# Altium schematic sheet 2_SCH_Autolog.SchDoc: PROYECTO FINAL - AutoLog
size A4; SheetNumber: 3; SheetTotal: 4
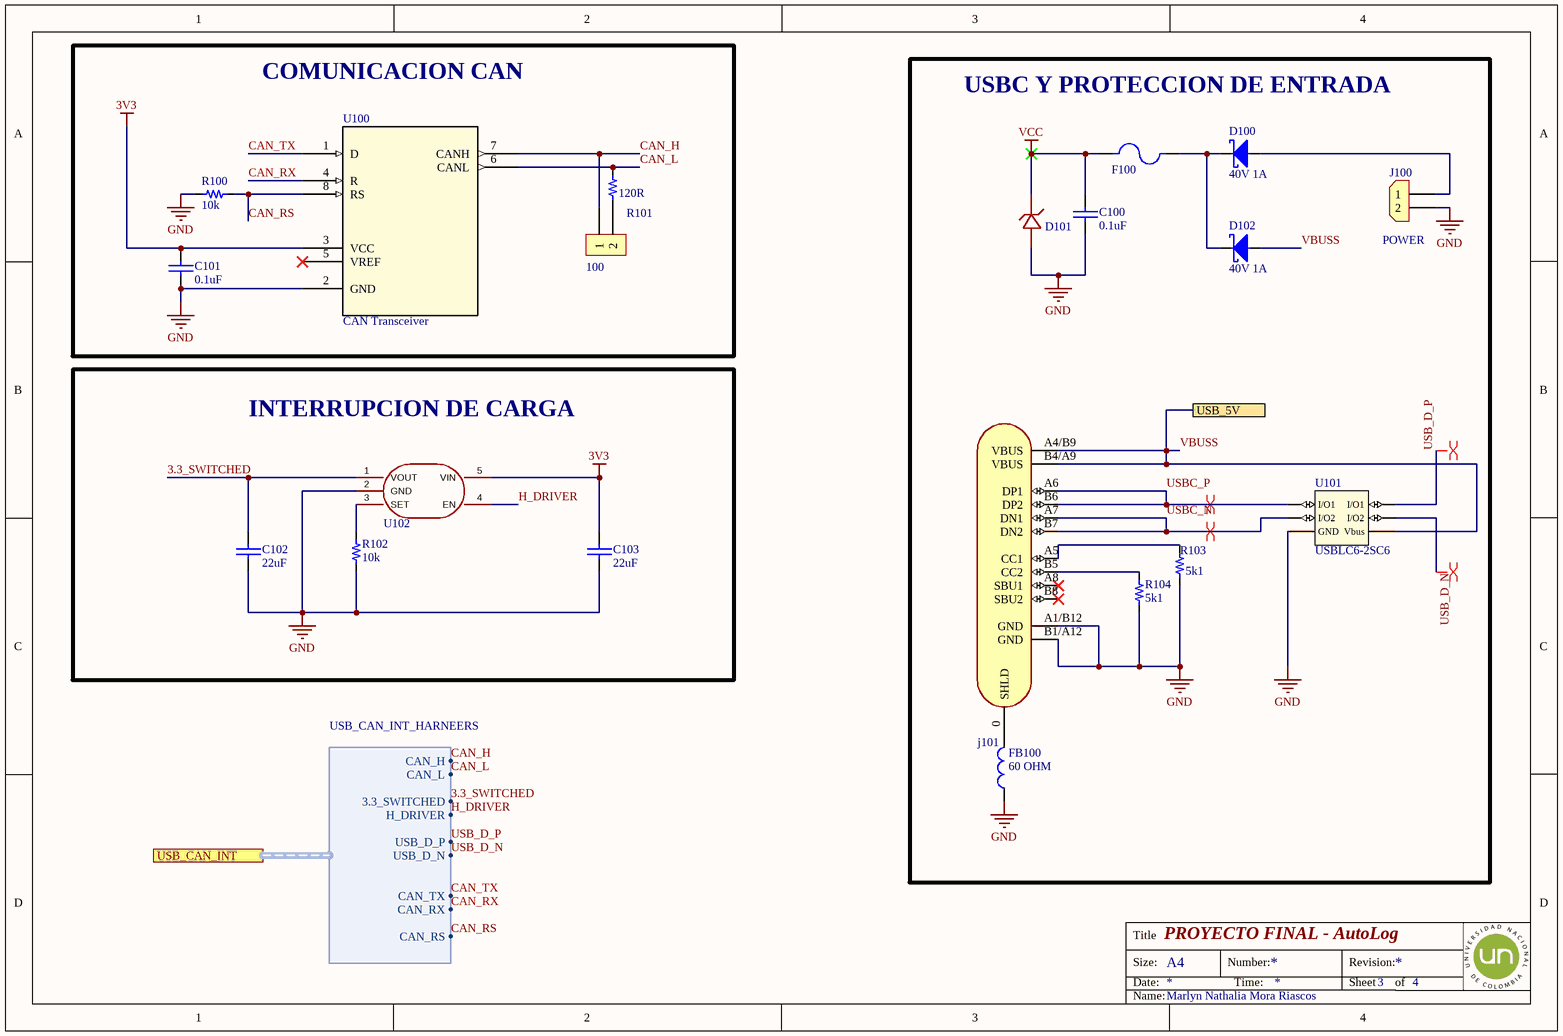
[diagram p0: 2_SCH_Autolog.SchDoc]

## Parts
100  2x1  [H_2x1_TH_100mil]  (value not drawn)  (no BOM)
C100  value 0.1uF  [0603_cap]  (hidden comment: 0.1uF 50V)
C101  value 0.1uF  [0603_cap]  (hidden comment: 0.1uF 50V)
C102  value 22uF  [0603_cap]  (hidden comment: 22uF 10V)
C103  value 22uF  [0603_cap]  (hidden comment: 22uF 10V)
D100  40V 1A  [SOD_123]
D101  TVS_DIODE_SMF30A  [TVS_DIODE_SMF30A]  (value not drawn)
D102  40V 1A  [SOD_123]
F100  PTC_MF-MSMF110/16-2  [FUSER_MF-MSMF110/16-2]  (value not drawn)
FB100  value 60 OHM  [0603_fb]  (hidden comment: 60OHM 2A)
J100  POWER  [CON_2x1_TH_5MM]
j101  USB C  [CON_USB_C_16P_RA]  (value not drawn)
R100  value 10k  [0603_res]  (hidden comment: 10k 1/10W)
R101  value 120R  [0603_res]  (hidden comment: 120R 1/10W)
R102  value 10k  [0603_res]  (hidden comment: 10k 1/10W)
R103  value 5k1  [0603_res]  (hidden comment: 5k1 1/10W)
R104  value 5k1  [0603_res]  (hidden comment: 5k1 1/10W)
U100  CAN Transceiver  [D8-M]
U101  USBLC6-2SC6  [SOT_23_6]
U102  MT9700  [SOT-23-5_L3.0-W1.7-P0.95-LS2.8-BR]  (value not drawn)

## Blocks framed on the sheet
COMUNICACION CAN: 100 C101 R100 R101 U100
USBC Y PROTECCION DE ENTRADA: C100 D100-D102 F100 FB100 J100 j101 R103 R104 U101
INTERRUPCION DE CARGA: C102 C103 R102 U102

## Ports
USB_5V (see Maiin[3B], 3_SCH_Autolog[3A]), USB_CAN_INT (harness USB_CAN_INT_HARNEERS, see Maiin[3A], 1_SCH_Autolog[2D])

## Harnesses
USB_CAN_INT_HARNEERS: USB_D_P, USB_D_N, H_DRIVER, 3.3_SWITCHED, CAN_L, CAN_TX, CAN_RX, CAN_RS, CAN_H

## Nets
3V3: C101.2 C103.1 U100.3(VCC) U102.5(VIN)
GND: C100.1 C101.1 C102.2 C103.2 D101.2 FB100.1 J100.2 j101.A1/B12(GND) j101.B1/A12(GND) R100.1 R102.1 R103.1 R104.2 U100.2(GND) U101.2(GND) U102.2(GND)
VCC: C100.2 D101.1 F100.1
3.3_SWITCHED: C102.1 U102.1(VOUT) ; port USB_CAN_INT.3.3_SWITCHED
CAN_H: 100.1 U100.7(CANH) ; port USB_CAN_INT.CAN_H
CAN_L: R101.2 U100.6(CANL) ; port USB_CAN_INT.CAN_L
CAN_RS: R100.2 U100.8(RS) ; port USB_CAN_INT.CAN_RS
CAN_RX: U100.4(R) ; port USB_CAN_INT.CAN_RX
CAN_TX: U100.1(D) ; port USB_CAN_INT.CAN_TX
H_DRIVER: U102.4(EN) ; port USB_CAN_INT.H_DRIVER
USB_D_N: U101.4(I/O2) ; port USB_CAN_INT.USB_D_N
USB_D_P: U101.6(I/O1) ; port USB_CAN_INT.USB_D_P
USBC_N: j101.A7(DN1) j101.B7(DN2) U101.3(I/O2)
USBC_P: j101.A6(DP1) j101.B6(DP2) U101.1(I/O1)
VBUSS: D102.2 j101.A4/B9(VBUS) j101.B4/A9(VBUS) U101.5(Vbus) ; port USB_5V
Net100_2: 100.2 R101.1
NetD100_1: D100.1 D102.1 F100.2
NetD100_2: D100.2 J100.1
NetFB100_2: FB100.2 j101.0(SHLD)
Netj101_A5: j101.A5(CC1) R103.2
Netj101_B5: j101.B5(CC2) R104.1
NetR102_2: R102.2 U102.3(SET)

Not connected (* = marked no-connect by the designer): j101 A8(SBU1)* B8(SBU2)*; U100 5(VREF)*

## Layout directives
differential pair: USB_D_N, USB_D_P, USBC_N, USBC_P

## Notes on the sheet
- Title
- Size:
- Date:
- A4
- Number:
- Time:
- Revision:
- Sheet
- of
- Name:
- Marlyn Nathalia Mora Riascos

## Library data of the parts
100 = H_Male_2x1_TH_100mil: ComponentLink1Description: LCSC
C100 C101 = Cap_0.1uF_0603_50V: 50V 100nF Y5V -20%~+80% 0603 Multilayer Ceramic Capacitors MLCC - SMD/SMT ROHS; Manufacturer: Walsin Tech Corp; Manufacturer Part Number: 0603F104Z500CT; Supplier 1: LCSC; Supplier Part Number 1: C83060; ComponentLink1Description: LCSC; ComponentLink1URL: https://www.lcsc.com/product-detail/Multilayer-Ceramic-Capacitors-MLCC-SMD-SMT_Walsin-Tech-Corp-0603F104Z500CT_C83060.html; ComponentLink2Description: Datasheet; ComponentLink2URL: https://www.lcsc.com/datasheet/C83060.pdf
C102 C103 = Cap_22uF_0603_10V: 10V 22uF X5R ±20% 0603 Multilayer Ceramic Capacitors MLCC - SMD/SMT ROHS; Manufacturer: HRE; Manufacturer Part Number: CGA0603X5R226M100JT; Supplier 1: LCSC; Supplier Part Number 1: C6119863; ComponentLink1Description: LCSC; ComponentLink1URL: https://lcsc.com/product-detail/Multilayer-Ceramic-Capacitors-MLCC-SMD-SMT_HRE-CGA0603X5R226M100JT_C6119863.html; ComponentLink2Description: Datasheet; ComponentLink2URL: https://www.lcsc.com/datasheet/C6119863.pdf
D100 D102 = D_Schottky_40V_1A_SOD_123F: DIODE SCHOTTKY 40V 1A SOD123F; Manufacturer: Shanghai Prisemi Elec; Manufacturer Part Number: PSBD1DF40V1H; Supplier 1: LCSC; Supplier Part Number 1: C110730; ComponentLink1Description: LCSC; ComponentLink1URL: https://www.lcsc.com/product-detail/Switching-Diode_Shanghai-Prisemi-Elec-PSBD1DF40V1H_C110730.html; ComponentLink2Description: Datasheet; ComponentLink2URL: https://www.lcsc.com/datasheet/C110730.pdf
D101 = TVS_DIODE_SMF30A: TVS DIODE 30VWM 48.4VC SOD123F; Manufacturer: Diotec Semiconductor; Manufacturer Part Number: SMF30A; Supplier 1: digikey; Supplier Part Number 1: 4878-SMF30ATR-ND; ComponentLink1Description: digikey; ComponentLink1URL: https://www.digikey.com/en/products/detail/diotec-semiconductor/SMF30A/13164473; ComponentLink2Description: Datasheet; ComponentLink2URL: https://diotec.com/request/datasheet/smf50a.pdf
F100 = PTC_MF-MSMF110/16-2: Polymeric PTC Resettable Fuse 16V 1.1 A Ih Surface Mount 1812 (4532 Metric), Concave; Manufacturer: Bourns Inc.; Manufacturer Part Number: MF-MSMF110/16-2; Supplier 1: digikey; Supplier Part Number 1: MF-MSMF110/16-2TR-ND; ComponentLink1Description: digikey; ComponentLink1URL: https://www.digikey.com/en/products/detail/bourns-inc/MF-MSMF110-16-2/662820?s=N4IgTCBcDaIEIHkCqAlAcgZQAQFkBiAtDhvgIykAMA9KQGwEQC6AvkA; ComponentLink2Description: Datasheet; ComponentLink2URL: https://www.bourns.com/docs/product-datasheets/mf-msmf.pdf
FB100 = FB_60_0603_2A: 2A 1 100mΩ 60Ω@100MHz ±25% 0603 Ferrite Beads ROHS; Manufacturer: TAI-TECH; Manufacturer Part Number: HCB1608KF-600T20; ComponentLink1Description: LCSC; ComponentLink1URL: https://www.lcsc.com/product-detail/Ferrite-Beads_TAI-TECH-HCB1608KF-600T20_C369516.html; Supplier 1: LCSC; Supplier Part Number 1: C369516
J100 = Con_2x1_TH_5mm: 2POS 5MM; Manufacturer: JILN; Manufacturer Part Number: JL126-50002G01; Supplier 1: LCSC; Supplier Part Number 1: C394556; ComponentLink1Description: LCSC; ComponentLink1URL: https://www.lcsc.com/product-detail/Screw-terminal_JILN-JL126-50002G01_C394556.html; ComponentLink2Description: Datasheet; ComponentLink2URL: https://www.lcsc.com/datasheet/C394556.pdf
j101 = CON_USB_TYPEC_16P: 3A USB 3.1 1 Surface Mount 16P Female -40℃~+85℃ Type-C SMD USB Connectors ROHS; Manufacturer: SHOU HAN; Manufacturer Part Number: TYPE-C-3.1-16PIN; Supplier 1: LCSC; Supplier Part Number 1: C7507405; ComponentLink1Description: LCSC; ComponentLink1URL: https://lcsc.com/product-detail/USB-Connectors_SHOU-HAN-TYPE-C-3-1-16PIN_C7507405.html; ComponentLink2Description: Datasheet
R100 R102 = Res_10k_0603_1/10W: RES SMD 10k OHM 5% 1/10W 0603; Manufacturer: FOJAN; Manufacturer Part Number: FRC0603J103TS; ComponentLink1URL: https://www.lcsc.com/product-detail/Chip-Resistor-Surface-Mount_FOJAN-FRC0603J103TS_C2930027.html; Supplier 1: LCSC; Supplier Part Number 1: C2930027; ComponentLink1Description: LCSC; ComponentLink2Description: Datasheet; ComponentLink2URL: https://www.lcsc.com/datasheet/C2930027.pdf
R101 = Res_120R_0603_1/10W: 100mW Thick Film Resistor 75V ±100ppm/℃ ±1% 120Ω 0603 Chip Resistor - Surface Mount ROHS; Manufacturer: FOJAN; Manufacturer Part Number: FRC0603F1200TS; ComponentLink1URL: https://lcsc.com/product-detail/Chip-Resistor-Surface-Mount_FOJAN-FRC0603F1200TS_C2906988.html; Supplier 1: LCSC; Supplier Part Number 1: C2906988; ComponentLink1Description: LCSC; ComponentLink2Description: Datasheet; ComponentLink2URL: https://www.lcsc.com/datasheet/C2906988.pdf
R103 R104 = Res_5k1_0603: RES 5.1kΩ ±1% 100mW 0603; Manufacturer: YAGEO; Manufacturer Part Number: RC0603FR-0773K2L; ComponentLink1URL: https://www.lcsc.com/product-detail/Chip-Resistor-Surface-Mount_UNI-ROYAL-Uniroyal-Elec-0603W8F5101T5E_C23186.html; Supplier 1: LCSC; Supplier Part Number 1: C163420; ComponentLink1Description: LCSC
U100 = SN65HVD230DR-CAN: Transceiver Half CANbus 8-SOIC; Manufacturer: Texas Instruments; Suplier  Part Number: 296-11654-2-ND; Manufacturer product number: SN65HVD230DR; ComponentLink1Description: DataSheep; ComponentLink1URL: https://www.ti.com/lit/ds/symlink/sn65hvd230.pdf?HQS=dis-dk-null-digikeymode-dsf-pf-null-wwe&ts=1793387216556&ref_url=https%253A%252F%252Fwww.ti.com%252Fgeneral%252Fdocs%252Fsuppproductinfo.tsp%253FdistId%253D10%2526gotoUrl%253Dhttps%253A%252F%252Fwww.ti.com%252Flit%252Fgpn%252Fsn65hvd230; Supplier 1: Digi-Key; ComponentLink2Description: Digi-Key; ComponentLink2URL: https://www.digikey.com/en/products/detail/texas-instruments/SN65HVD230DR/404367
U101 = TVS_5.25V_2CH_SOT_23_6: TVS DIODE 5.25V 17V SOT23-6; Manufacturer: STMicroelectronics; ComponentLink1Description: LCSC; ComponentLink1URL: https://www.lcsc.com/product-detail/ESD-Protection-Devices_STMicroelectronics-USBLC6-2SC6_C7519.html; Supplier 1: LCSC; Manufacturer Part Number: USBLC6-2SC6; Supplier Part Number 1: C7519
U102 = MT9700: Switch de potencia con límite de corriente y control enable para corte en sleep de periféricos y MicroSD; Manufacturer: XI'AN Aerosemi Tech; Manufacturer Part Number: MT9700; Supplier 1: LCSC; Supplier Part Number 1: C89855; ComponentLink1Description: LCSC; ComponentLink1URL: https://www.lcsc.com/product-detail/C89855.html?s_z=n_q_MT9700%2520SOT-23-5; ComponentLink2Description: Datasheet; ComponentLink2URL: https://www.lcsc.com/datasheet/C89855.pdf